# Altium project Lora_SensorNetworkNode_V0.1.PrjPCB
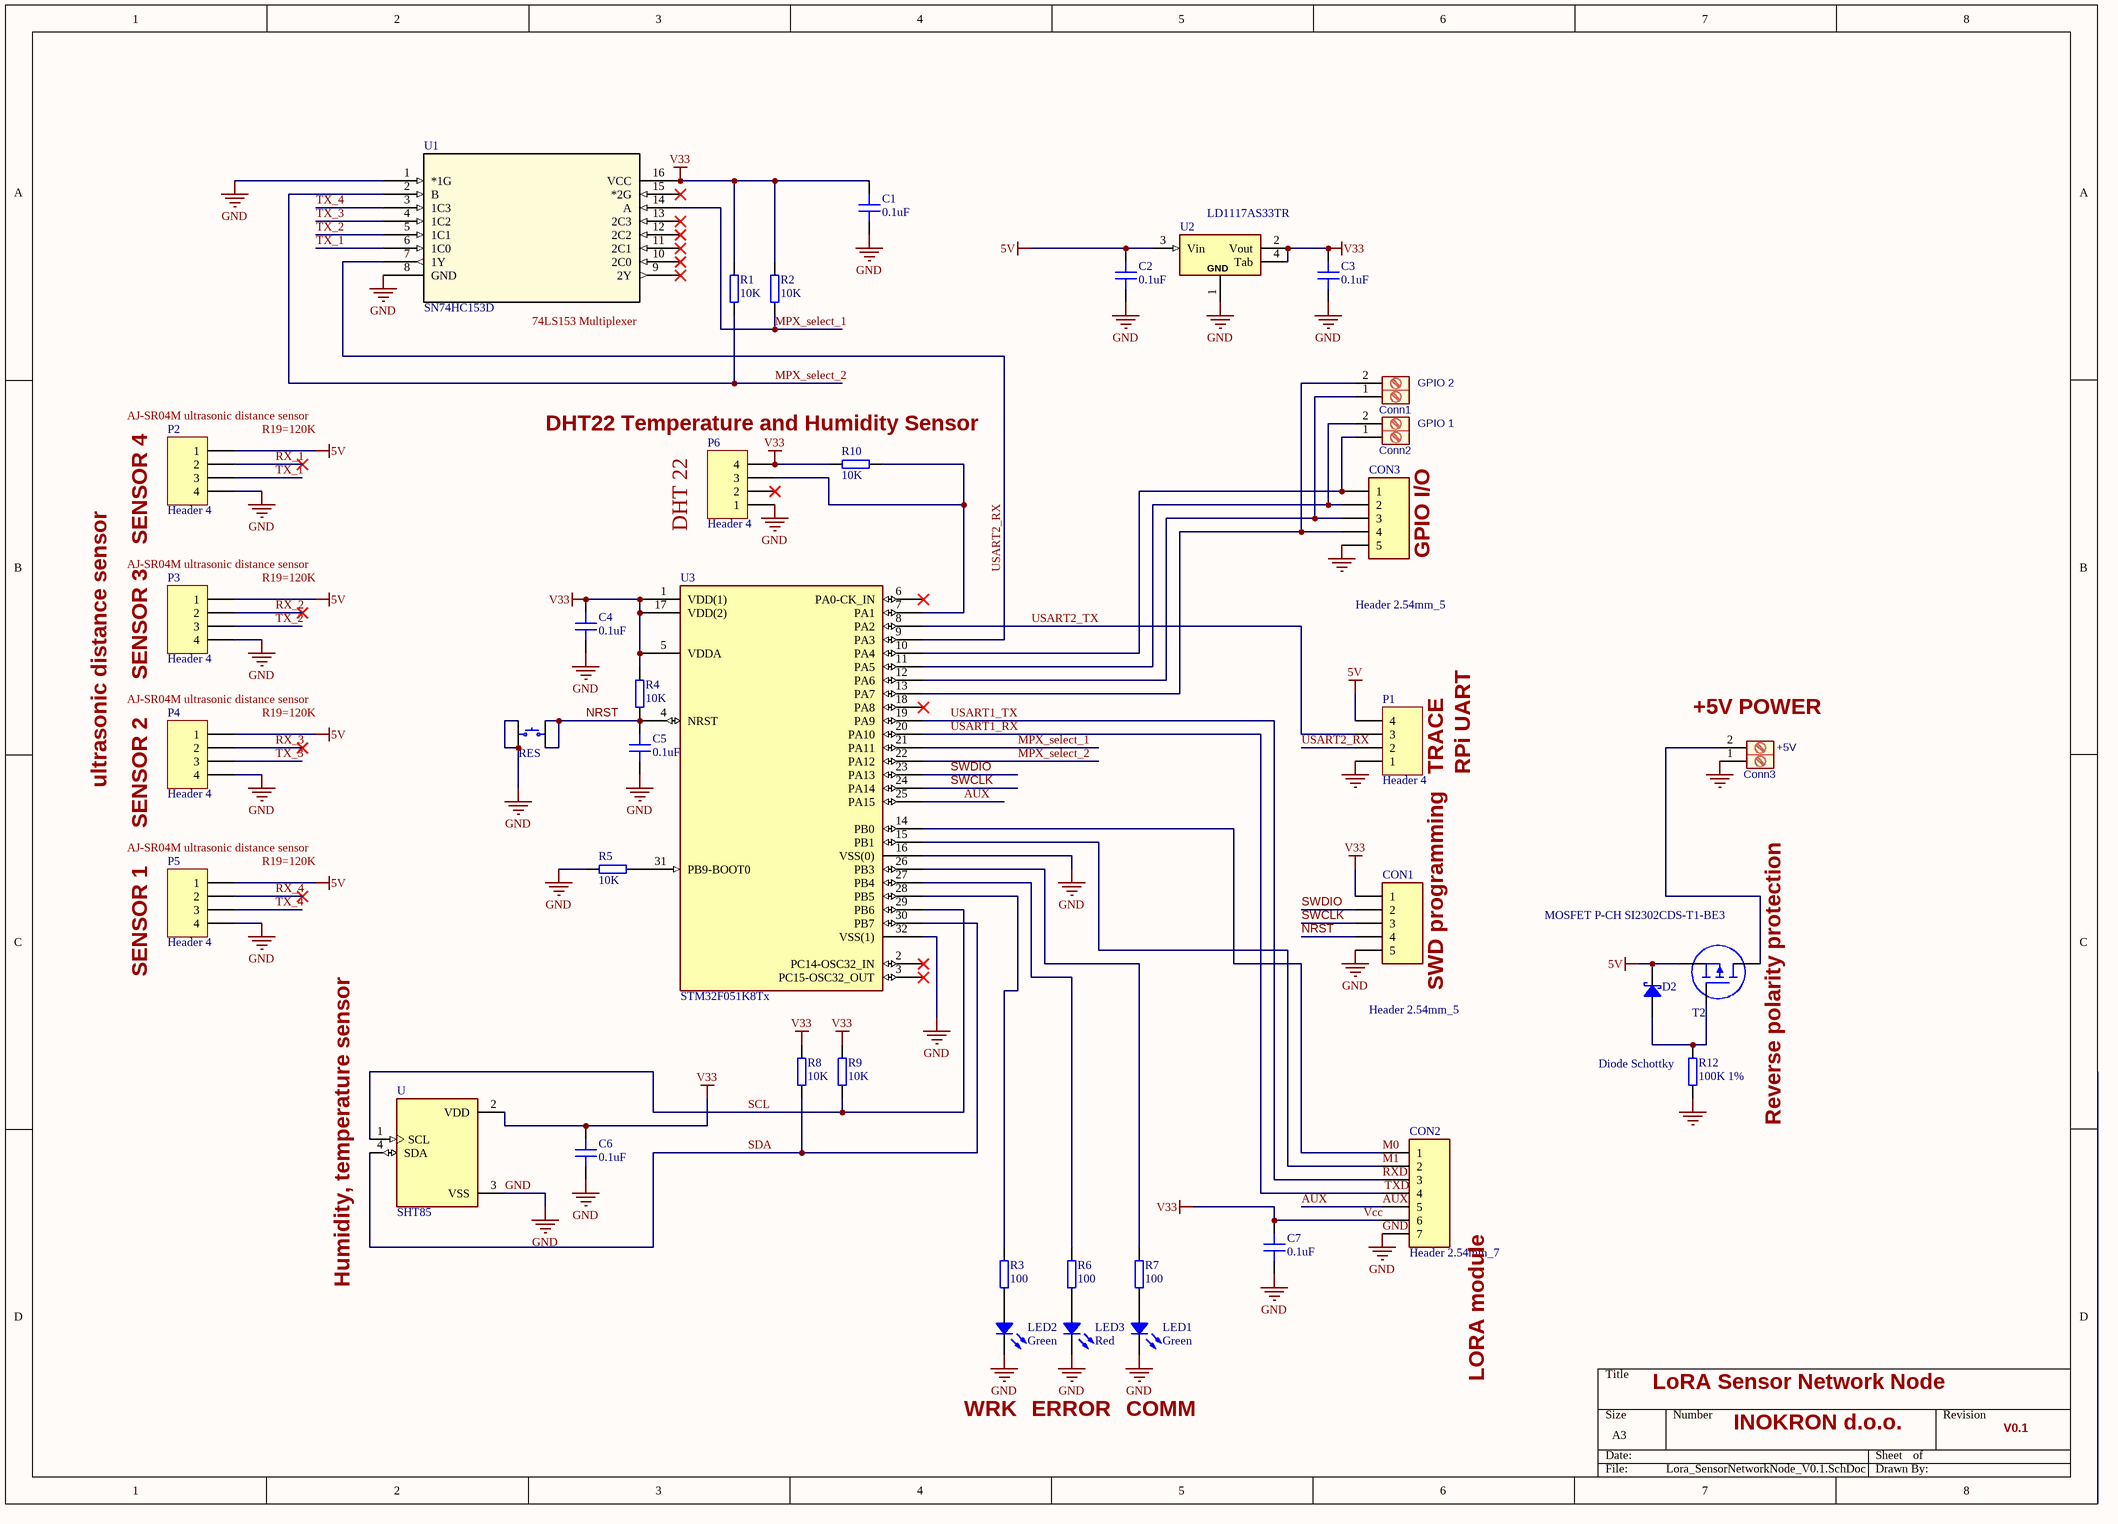
[diagram p0: Lora_SensorNetworkNode_V0.1.SchDoc]
1 sheet, 40 parts. Net scope: global (net labels, ports and power ports of the same name join across sheets).
Board file: Lora_SensorNetworkNode_V0.1.PcbDoc

## Sheet Lora_SensorNetworkNode_V0.1.SchDoc
size A3

### Parts
C1  0.1uF  [CAP 0805/2012 RF]
C2  0.1uF  [CAP 0805/2012 RF]
C3  0.1uF  [CAP 0805/2012 RF]
C4  0.1uF  [CAP 0805/2012 RF]
C5  0.1uF  [CAP 0805/2012 RF]
C6  0.1uF  [CAP 0805/2012 RF]
C7  0.1uF  [CAP 0805/2012 RF]
CON1  Header 2.54mm_5  [HDR1X5]
CON2  Header 2.54mm_7  [HDR1X7]
CON3  Header 2.54mm_5  [HDR1X5]
Conn1  GPIO 2  [CON_TERM_BLOCK_31X2]
Conn2  GPIO 1  [CON_TERM_BLOCK_31X2]
Conn3  +5V  [CON_TERM_BLOCK_31X2]
D2  Diode Schottky  [SOD-123W]
LED1  Green  [LED 0805/2012 YELLOW]
LED2  Green  [LED 0805/2012 YELLOW]
LED3  Red  [LED 0805/2012 YELLOW]
P1  Header 4  [HDR1X4]
P2  Header 4  [HDR1X4]
P3  Header 4  [HDR1X4]
P4  Header 4  [HDR1X4]
P5  Header 4  [HDR1X4]
P6  Header 4  [HDR1X4]
R1  10K  [RES 0805/2012 RF]
R2  10K  [RES 0805/2012 RF]
R3  100  [RES 0805/2012 RF]
R4  10K  [RES 0805/2012 RF]
R5  10K  [RES 0805/2012 RF]
R6  100  [RES 0805/2012 RF]
R7  100  [RES 0805/2012 RF]
R8  10K  [RES 0805/2012 RF]
R9  10K  [RES 0805/2012 RF]
R10  10K  [RES 0805/2012 RF]
R12  100K 1%  [RES 0805/2012 RF]
RES  TACTILE_SW_MICRO_CHINA  [TACTILE_SW_2x3x4mm]  (value not drawn)
T2  MOSFET P-CH SI2302CDS-T1-BE3  [SOT23]
U  SHT85  [XDCR_SHT85]
U1  SN74HC153D  [SO-16_m]
U2  LD1117AS33TR  [SOT-223]
U3  STM32F051K8Tx  [TQFP_32pin]

### Nets
5V: C2.2 D2.1(K) P1.4 P2.1 P3.1 P4.1 P5.1 T2.2(S) U2.3(Vin)
GND: C1.1 C2.1 C3.1 C4.1 C5.1 C6.1 C7.1 CON1.5 CON2.7 CON3.5 Conn3.1 LED1.2 LED2.2 LED3.2 P1.1 P2.4 P3.4 P4.4 P5.4 P6.1 R5.1 R12.1 RES.1 RES.3 U.3(VSS) U1.1(*1G) U1.8(GND) U2.1 U3.16(VSS(0)) U3.32(VSS(1))
Vcc: C1.2 C3.2 C4.2 C6.2 C7.2 CON1.1 CON2.6 P6.4 R1.2 R2.2 R4.2 R8.2 R9.2 R10.2 U.2(VDD) U1.16(VCC) U2.2(Vout) U2.4(Tab) U3.1(VDD(1)) U3.5(VDDA) U3.17(VDD(2))  [also labelled V33]
AUX: CON2.5 U3.25(PA15)
M0: CON2.1 U3.14(PB0)
M1: CON2.2 U3.15(PB1)
MPX_select_1: R2.1 U1.14(A) U3.21(PA11)
MPX_select_2: R1.1 U1.2(B) U3.22(PA12)
NRST: C5.2 CON1.4 R4.1 RES.2 RES.4 U3.4(NRST)
RX_1: P2.2
RX_2: P3.2
RX_3: P4.2
RX_4: P5.2
RXD: CON2.3 U3.19(PA9)  [also labelled USART1_TX]
SCL: R9.1 U.1(SCL) U3.29(PB6)
SDA: R8.1 U.4(SDA) U3.30(PB7)
SWCLK: CON1.3 U3.24(PA14)
SWDIO: CON1.2 U3.23(PA13)
TX_1: P2.3 U1.6(1C0)
TX_2: P3.3 U1.5(1C1)
TX_3: P4.3 U1.4(1C2)
TX_4: P5.3 U1.3(1C3)
USART1_RX: CON2.4 U3.20(PA10)
USART2_RX: P1.2 U1.7(1Y) U3.9(PA3)
USART2_TX: P1.3 U3.8(PA2)
NetCON3_1: CON3.1 Conn2.1 U3.10(PA4)
NetCON3_2: CON3.2 Conn2.2 U3.11(PA5)
NetCON3_3: CON3.3 Conn1.1 U3.12(PA6)
NetCON3_4: CON3.4 Conn1.2 U3.13(PA7)
NetConn3_2: Conn3.2 T2.3(D)
NetD2_2: D2.2(A) R12.2 T2.1(G)
NetLED1_1: LED1.1 R7.2
NetLED2_1: LED2.1 R3.2
NetLED3_1: LED3.1 R6.2
NetP6_3: P6.3 R10.1 U3.7(PA1)
NetR3_1: R3.1 U3.28(PB5)
NetR5_2: R5.2 U3.31(PB9-BOOT0)
NetR6_1: R6.1 U3.27(PB4)
NetR7_1: R7.1 U3.26(PB3)

Not connected (* = marked no-connect by the designer): P6 2*; U1 9(2Y)* 10(2C0)* 11(2C1)* 12(2C2)* 13(2C3)* 15(*2G)*; U3 2(PC14-OSC32_IN)* 3(PC15-OSC32_OUT)* 6(PA0-CK_IN)* 18(PA8)*

### Notes on the sheet
- (near U1) 74LS153 Multiplexer
- (near P2) AJ-SR04M ultrasonic distance sensor
- R19=120K
- DHT22 Temperature and Humidity Sensor
- (near P3) AJ-SR04M ultrasonic distance sensor
- SENSOR 4
- DHT 22
- GPIO I/O
- (near P4) AJ-SR04M ultrasonic distance sensor
- SENSOR 3
- (near Conn3) +5V POWER
- ultrasonic distance sensor
- (near P1) TRACE
- RPi UART
- (near P5) AJ-SR04M ultrasonic distance sensor
- SENSOR 2
- SENSOR 1
- (near CON1) SWD programming
- (near T2) Reverse polarity protection
- LORA module
- (near U) Humidity, temperature sensor
- LoRA Sensor Network Node
- WRK
- ERROR
- COMM
- INOKRON d.o.o.
- V0.1
- Labels drawn without touching a wire or pin: TXD
- (in symbol LD1117) GND

### Library data of the parts
C1-C7 = Capacitor: SMT Capacitor; Value: 0.1uF
CON1 CON3 = Header 2.54mm_5: Header, 5-Pin; LatestRevisionDate: 17-Jul-2002; LatestRevisionNote: Re-released for DXP Platform.; Publisher: Altium Limited
CON2 = Header 2.54mm_7: Header, 7-Pin; LatestRevisionDate: 17-Jul-2002; LatestRevisionNote: Re-released for DXP Platform.; Publisher: Altium Limited
Conn1-Conn3 = TERMINAL_BLOCK_31X2: Terminal Block(Aliexpress) THT 3.1 2-pin; Part Number: TERMINAL_BLOCK_381X2; Value: IN1; Lib Main: Connectors; RD_IDENT: RD00078; STATE: R&D; RLS IDENT: ---; Designator: P?; ConfirmedBy: OLD; MULTICOMP: MC000018; Lib Sub1: TerminalBlock; MountingType: THT; CreatedBy: OLD; Farnell: 2007985
D2 = Diode Schottky: Schottky Diode; Manufacturer_Name: Nexperia; Manufacturer_Part_Number: PMEG6010ELRX; Datasheet Link: https://assets.nexperia.com/documents/data-sheet/PMEG6010ELR.pdf; Value: *; Price_1000: 0,09700; mouser: https://eu.mouser.com/ProductDetail/Nexperia/PMEG6010ELRX?qs=Yna0arPQ0CTfJYBa%252B8ef6A%3D%3D
LED1-LED3 = LED: Chip LED
  LED1 LED2: Value: Green
  LED3: Value: Red
P1-P6 = Header 4: Header, 4-Pin; LatestRevisionDate: 17-Jul-2002; LatestRevisionNote: Re-released for DXP Platform.; Publisher: Altium Limited
R1-R10 R12 = Resistor: SMT Resistor
  R1 R2 R4 R5 R8-R10: Value: 10K
  R3 R6 R7: Value: 100
  R12: Value: 100K 1%
RES = TACTILE_SW_MICRO_CHINA: TEILE/LOS 3*4*2mm SMD Schalter 4 Pin Touch Micro Switch Tact Push Button; Farnell: Aliexpress; Manufacture: https://de.aliexpress.com/item/4001125176759.html?spm=a2g0o.cart.0.0.757d38daiRADTA&mp=1&gatewayAdapt=glo2deu
T2 = MOSFET P-CH: mouser: https://eu.mouser.com/ProductDetail/Vishay-Siliconix/SI2302CDS-T1-BE3?qs=CiayqK2gdcKmknxSqRbb7w%3D%3D
U = SHT85: Humidity Temperature Sensor 0 ~ 100% RH Digital Â±1.5% RH 8s Through Hole; MF: Sensirion AG; SnapEDA_Link: https://www.snapeda.com/parts/SHT85/Sensirion%20AG/view-part/3601545/?ref=snap; Value: *; Digi-Key_Part_Number: 1649-1110-ND; Digi-Key_Purchase_URL: https://www.digikey.com/product-detail/en/sensirion-ag/SHT85/1649-1110-ND/9666378?utm_source=snapeda&utm_medium=aggregator&utm_campaign=symbol; MP: SHT85; Package: SIP-4 Sensirion AG
U1 = SN74HC153D: Dual 4-Line To 1-Line Data Selectors/Multiplexers 16-SOIC -40 to 85; Manufacturer_Name: Texas Instruments; Copyright: Copyright (C) 2025 Ultra Librarian. All rights reserved.; Manufacturer_Part_Number: SN74HC153D; Datasheet: https://www.ti.com/lit/gpn/sn74hc153; RefDes: RefDes; Type: Type
U2 = LD1117: LDO voltage regulator; farnell: https://si.farnell.com/stmicroelectronics/ld1117as33tr/ic-v-reg-ldo-3-3v-smd/dp/1467776
U3 = STM32F051K8Tx: ARM Microcontrollers - MCU Ultra-low-power ARM Cortex-M0+ MCU with 16-Kbytes Flash, 32 MHz CPU; Manufacturer_Name: STMicroelectronics; Manufacturer_Part_Number: STM32F051K8Tx; Price_1: 1,80000; Price_1000: 0,88600